# EAGLE design QTP-BITTREE PATCHBAY REV 2.1 (EAGLE 7.3.2)
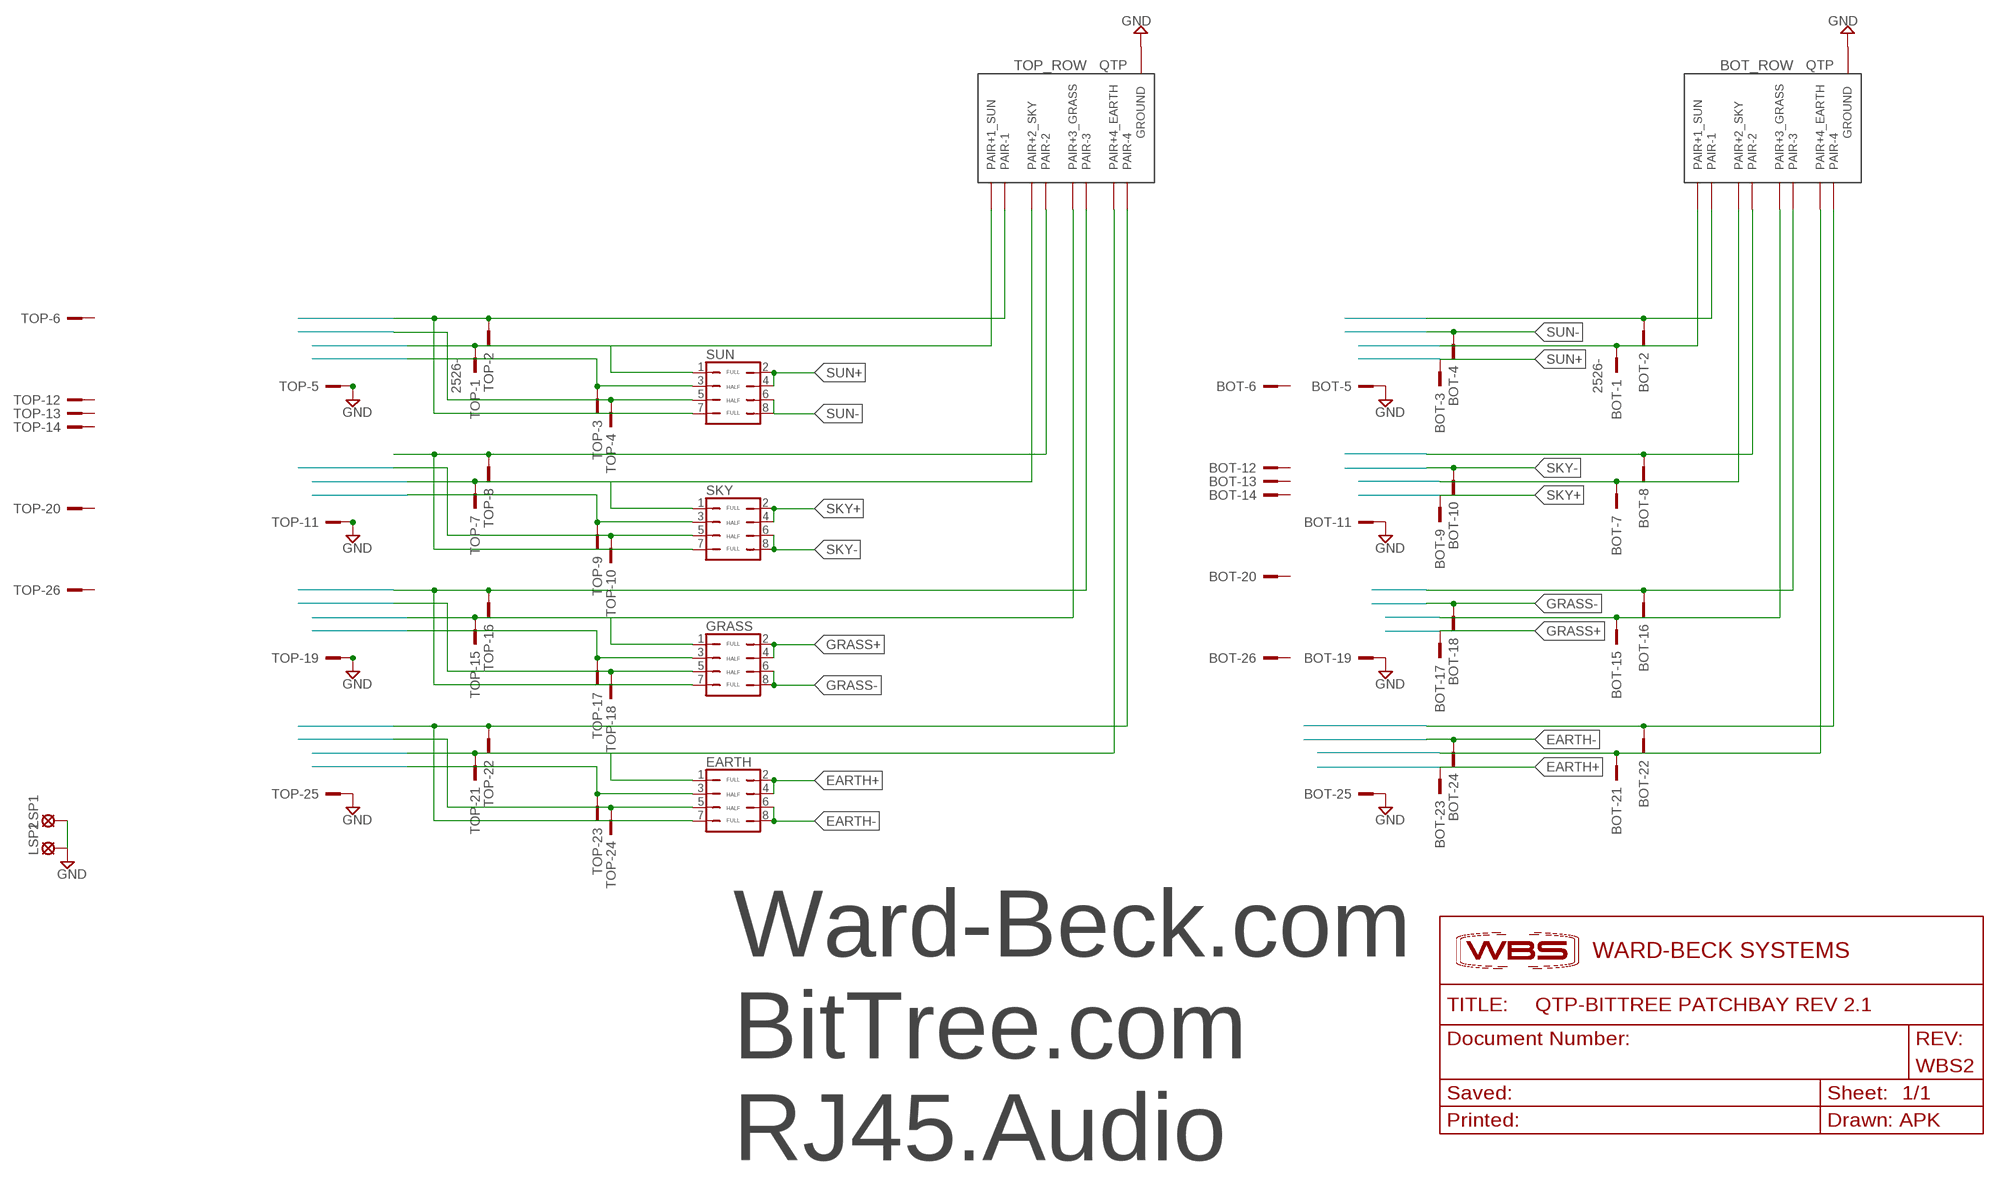
[diagram p0: schematic, sheet 1]

## Parts
BOT  2526-  [PAK100/2500-26]
BOT_ROW  CON-QTP_VERT  [ASSMAN-RJ45_VERT]
EARTH  JP4Q  [JP4Q]
GRASS  JP4Q  [JP4Q]
LSP1  LSP13  [LSP13]
LSP2  LSP13  [LSP13]
SKY  JP4Q  [JP4Q]
SUN  JP4Q  [JP4Q]
TOP  2526-  [PAK100/2500-26]
TOP_ROW  CON-QTP_VERT  [ASSMAN-RJ45_VERT]

## Nets
EARTH+: BOT.23 EARTH.2 EARTH.4
EARTH-: BOT.24 EARTH.6 EARTH.8
GND: BOT.5 BOT.11 BOT.19 BOT.25 BOT_ROW.P$9(GROUND) BOT_ROW.P$10(GROUND) BOT_ROW.P$11(GROUND) BOT_ROW.P$12(GROUND) LSP1.MP LSP2.MP TOP.5 TOP.11 TOP.19 TOP.25 TOP_ROW.P$9(GROUND) TOP_ROW.P$10(GROUND) TOP_ROW.P$11(GROUND) TOP_ROW.P$12(GROUND)
GRASS+: BOT.17 GRASS.2 GRASS.4
GRASS-: BOT.18 GRASS.6 GRASS.8
N$2: SUN.7 TOP.2 TOP_ROW.P$1(PAIR-1)
N$3: SKY.1 TOP.7 TOP_ROW.P$4(PAIR+2_SKY)
N$4: BOT.1 BOT_ROW.P$2(PAIR+1_SUN)
N$5: GRASS.1 TOP.15 TOP_ROW.P$6(PAIR+3_GRASS)
N$6: BOT.2 BOT_ROW.P$1(PAIR-1)
N$8: EARTH.1 TOP.21 TOP_ROW.P$8(PAIR+4_EARTH)
N$9: SUN.3 TOP.3
N$10: SUN.5 TOP.4
N$11: BOT.7 BOT_ROW.P$4(PAIR+2_SKY)
N$12: SKY.7 TOP.8 TOP_ROW.P$5(PAIR-2)
N$13: SKY.3 TOP.9
N$14: SKY.5 TOP.10
N$15: BOT.15 BOT_ROW.P$6(PAIR+3_GRASS)
N$16: GRASS.7 TOP.16 TOP_ROW.P$3(PAIR-3)
N$17: GRASS.3 TOP.17
N$18: GRASS.5 TOP.18
N$19: BOT.21 BOT_ROW.P$8(PAIR+4_EARTH)
N$20: EARTH.7 TOP.22 TOP_ROW.P$7(PAIR-4)
N$21: EARTH.3 TOP.23
N$22: EARTH.5 TOP.24
N$26: BOT.8 BOT_ROW.P$5(PAIR-2)
N$29: BOT.16 BOT_ROW.P$3(PAIR-3)
N$32: BOT.22 BOT_ROW.P$7(PAIR-4)
SKY+: BOT.9 SKY.2 SKY.4
SKY-: BOT.10 SKY.6 SKY.8
SUN+: BOT.3 SUN.2 SUN.4
SUN-: BOT.4 SUN.6 SUN.8
TOP-P1: SUN.1 TOP.1 TOP_ROW.P$2(PAIR+1_SUN)
Unconnected: BOT.6 BOT.12 BOT.13 BOT.14 BOT.20 BOT.26 TOP.6 TOP.12 TOP.13 TOP.14 TOP.20 TOP.26

## Notes on the sheet
- FULL
- HALF
- HALF
- FULL
- FULL
- HALF
- HALF
- FULL
- FULL
- HALF
- HALF
- FULL
- FULL
- HALF
- HALF
- FULL
- Ward-Beck.com
- BitTree.com
  RJ45.Audio

## Library data of the parts
BOT TOP = con-3m:2526-: 3M (TM) Pak 100 4-Wall Header Source: 3M; OC_FARNELL: unknown; OC_NEWARK: unknown
BOT_ROW TOP_ROW = APK - PARTS:CON-QTP_VERT
EARTH GRASS SKY SUN = jumper:JP4Q: JUMPER
LSP1 LSP2 = solpad:LSP13: SOLDER PAD drill 1.3 mm, distributor Buerklin, 12H562

## Board
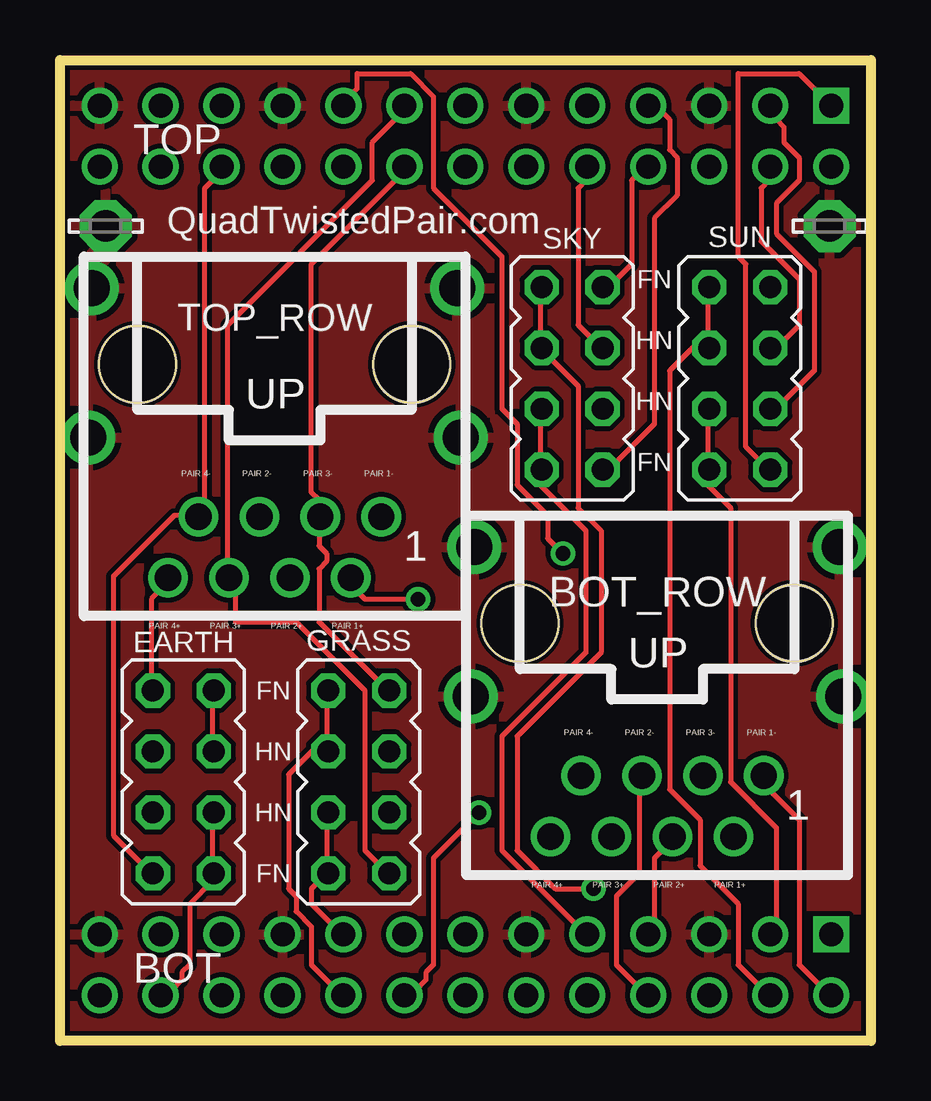
[diagram p1: board, top side]
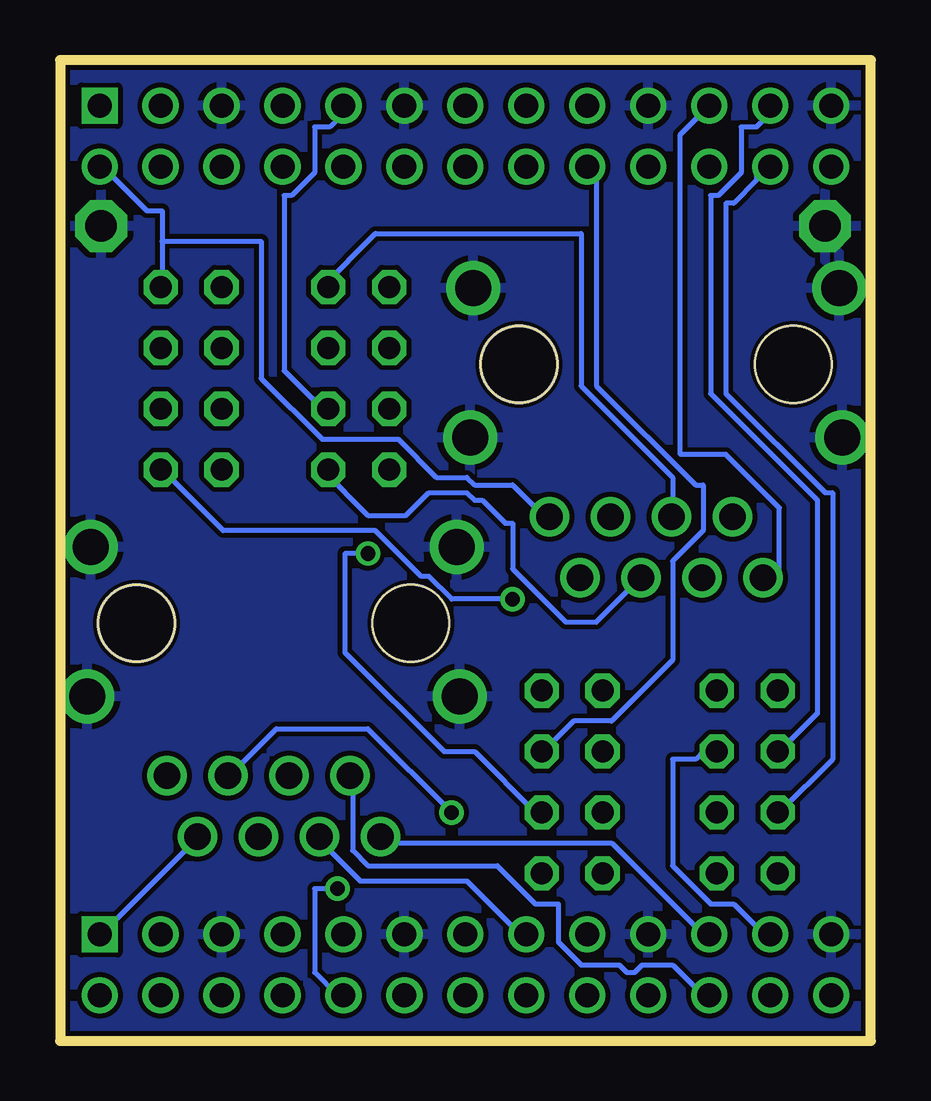
[diagram p2: board, bottom side, seen from below]

Size 33.78 x 40.89 mm. Coordinates in mm from the lower left corner, seen from the top.
Outline: 0,40.89 33.78,40.89 33.78,0 0,0 0,40.89
Copper layers (1*16): Top 0.035mm / dielectric 1.5mm / Bottom 0.035mm
Design rules "default *": minimum track width 8mil, minimum drill 24mil, track to track 8mil, track to pad 8mil, pad to pad 8mil, via to via 8mil, smd to smd 8mil, copper to edge 8mil, drill to drill 8mil, minimum pad ring 10mil, minimum via ring 8mil, stop-mask expansion 4mil, vias tented up to drill 0mil, thermal gap 10mil
vRestrict: area 2.5,15.9 to 15.9,17.8; area 7.6,6.4 to 10.2,15.9; area 4.4,32.4 to 31.1,34.9; area 23.5,23.5 to 26,33.7; area 30.5,24.1 to 33.7,31.1; area 0,7 to 2.5,15.2

### Footprints (pad centres in the part's own frame; a part is rotated, then mirrored left to right if it is on the bottom)
PAK100/2500-26 = drill 1 pad 1.422 square: 1 -15.24,-1.27 | drill 1 pad 1.422: 2 -15.24,1.27; 3 -12.7,-1.27; 4 -12.7,1.27; 5 -10.16,-1.27; 6 -10.16,1.27; 7 -7.62,-1.27; 8 -7.62,1.27; 9 -5.08,-1.27; 10 -5.08,1.27; 11 -2.54,-1.27; 12 -2.54,1.27; 13 0,-1.27; 14 0,1.27; 15 2.54,-1.27; 16 2.54,1.27; 17 5.08,-1.27; 18 5.08,1.27; 19 7.62,-1.27; 20 7.62,1.27; 21 10.16,-1.27; 22 10.16,1.27; 23 12.7,-1.27; 24 12.7,1.27; 25 15.24,-1.27; 26 15.24,1.27
ASSMAN-RJ45_VERT = drill 1.1: P$1 -4.432,10.846; P$2 -3.162,13.386; P$3 -1.892,10.846; P$4 -0.622,13.386; P$5 0.648,10.846; P$6 1.918,13.386; P$7 3.188,10.846; P$8 4.458,13.386 | drill 1.5: P$9 -7.607,1.321; P$10 7.633,1.321; P$11 -7.744,7.539; P$12 7.767,7.539 | hole 3.2: -5.702,4.496; 5.728,4.496 | hole 3.175: -5.702,4.496
JP4Q = drill 0.914 octagon: 1 -3.81,-1.27; 2 -3.81,1.27; 3 -1.27,-1.27; 4 -1.27,1.27; 5 1.27,-1.27; 6 1.27,1.27; 7 3.81,-1.27; 8 3.81,1.27
LSP13 = drill 1.321 pad 2.159 octagon: MP 0,0

### Placement (x,y rotation side)
BOT  16.89,3.17 180 top
BOT_ROW  24.89,21.91 180 top
EARTH  5.14,10.79 270 top
GRASS  12.45,10.79 90 top
LSP1  1.91,33.97 0 top
LSP2  32.07,33.97 180 top
SKY  21.34,27.62 90 top
SUN  28.32,27.62 90 top
TOP  16.89,37.72 180 top
TOP_ROW  8.95,32.7 180 top

### Tracks (layer width: path | path; a pad name or v marks a point on that pad's centre or on a via)
EARTH+
  Top 0.203: EARTH.4 6.35,12.06 6.35,14.61 EARTH.2
  Bottom 0.203: EARTH.4 6.99,12.06 7.3,11.75 8.26,11.75 8.26,7.3 6.67,5.71 5.71,5.71 4.45,4.45 BOT.23
EARTH-
  Top 0.203: 6.35,6.99 6.35,9.53 EARTH.6 | 6.35,6.99 6.35,6.67 5.4,5.71 5.4,3.17 5.08,2.86 5.08,2.54 4.45,1.91 BOT.24 | 6.35,6.99 EARTH.8
GND
  pour Bottom: 0,40.89 33.78,40.89 33.78,0 0,0
  pour Top: 0,40.89 33.78,40.89 33.78,0 0,0
GRASS+
  Top 0.203: 11.11,6.99 11.11,9.53 GRASS.4 | 11.11,6.99 10.48,6.35 10.48,5.71 11.75,4.45 BOT.17 | 11.11,6.99 GRASS.2
GRASS-
  Top 0.203: 11.11,12.7 11.11,14.61 GRASS.8 | 11.11,12.7 11.11,12.06 GRASS.6 11.11,12.7 | 11.11,12.7 9.53,11.11 9.53,6.35 9.84,6.03 9.84,5.4 10.48,4.76 10.48,3.17 11.75,1.91 BOT.18
N$2
  Bottom 0.203: 29.53,33.34 29.53,34.61 30.16,34.61 31.75,36.2 32.07,36.2 TOP.2 | 29.53,33.34 29.53,31.43 SUN.7 | 29.53,33.34 25.4,33.34 25.4,27.62 22.86,25.08 19.68,25.08 18.1,23.5 16.83,23.5 16.51,23.18 14.92,23.18 13.65,21.91 TOP_ROW.P$1
N$3
  Top 0.203: SKY.1 22.86,23.81 24.77,25.72 24.77,34.29 25.72,35.24 25.72,36.83 25.4,37.15 25.4,38.42 24.77,39.05 TOP.7
  Bottom 0.203: TOP_ROW.P$4 11.43,17.46 12.7,17.46 14.92,19.68 14.92,21.59 15.24,21.59 16.19,22.54 16.51,22.54 16.83,22.86 18.41,22.86 19.37,21.91 20.95,21.91 22.86,23.81 SKY.1
N$4
  Bottom 0.203: BOT.1 32.07,4.45 28.26,8.26 BOT_ROW.P$2
N$5
  Top 0.203: GRASS.1 13.65,6.99 12.7,7.94 12.7,14.61 9.84,17.46 7.3,17.46 7.3,19.05 TOP_ROW.P$6 6.99,19.37 6.99,29.84 13.02,35.88 13.02,37.47 14.29,38.73 TOP.15
N$6
  Top 0.203: BOT.2 32.07,1.91 30.8,3.17 30.8,9.21 29.53,10.48 29.53,10.79 BOT_ROW.P$1
N$8
  Top 0.203: EARTH.1 3.81,14.61 3.81,18.41 4.45,19.05 TOP_ROW.P$8
  Bottom 0.203: TOP.21 7.94,37.78 7.94,24.45 6.03,24.45 3.81,22.23 3.81,19.37 4.45,19.37 TOP_ROW.P$8
N$9
  Top 0.203: SUN.3 29.84,26.35 31.43,27.94 31.43,32.07 29.84,33.66 29.84,34.92 30.8,35.88 30.8,36.83 30.16,37.47 30.16,38.1 29.84,38.42 29.84,38.73 TOP.3
N$10
  Top 0.203: SUN.5 29.84,28.89 30.8,29.84 30.8,31.75 29.21,33.34 29.21,35.56 29.53,35.88 29.53,36.2 TOP.4
N$11
  Top 0.203: BOT.7 24.77,4.45 24.77,7.62 25.4,8.26 BOT_ROW.P$4
N$12
  Top 0.203: SKY.7 22.86,31.43 23.81,32.38 23.81,35.88 24.45,36.51 TOP.8
  Bottom 0.203: TOP_ROW.P$5 8.26,21.91 8.26,23.5 12.06,27.3 12.06,33.66 20.64,33.66 22.86,31.43 SKY.7
N$13
  Bottom 0.203: SKY.3 22.86,26.35 24.45,27.94 24.45,35.24 24.13,35.24 23.18,36.2 23.18,38.1 22.54,38.1 21.91,38.73 TOP.9
N$14
  Top 0.203: SKY.5 22.54,28.89 21.59,29.84 21.59,35.56 21.91,35.88 21.91,36.2 TOP.10
N$15
  Bottom 0.203: BOT.15 14.61,4.45 16.83,6.67 21.27,6.67 22.86,8.26 BOT_ROW.P$6
N$16
  Top 0.203: GRASS.7 13.65,14.61 10.79,17.46 10.79,19.68 11.11,20 11.11,20.32 10.79,20.64 10.79,21.59 TOP_ROW.P$3 10.79,21.91 10.79,22.54 10.48,22.86 10.48,32.38 14.29,36.2 TOP.16
N$17  (via drill 0.61)
  Top 0.203: v20.95,20.32 20.32,20.95 20.32,21.91 19.05,23.18 19.05,25.72 18.41,26.35 18.41,32.7 15.56,35.56 15.56,39.37 14.61,40.32 12.38,40.32 12.38,39.69 12.06,39.37 12.06,39.05 TOP.17
  Bottom 0.203: v20.95,20.32 21.91,20.32 21.91,16.19 17.78,12.06 16.51,12.06 13.97,9.53 GRASS.3
N$18
  Bottom 0.203: GRASS.5 13.65,12.06 12.38,13.34 10.79,13.34 8.26,15.88 8.26,20 6.99,21.27 6.99,23.18 7.3,23.18 11.43,27.3 11.43,36.2 11.75,36.2 TOP.18
N$19
  Bottom 0.203: BOT.21 6.99,4.45 10.79,8.26 20.32,8.26 BOT_ROW.P$8
N$20
  Top 0.203: EARTH.7 3.81,6.99 2.22,8.57 2.22,19.37 4.76,21.91 5.71,21.91 TOP_ROW.P$7 6.03,21.91 6.03,35.56 6.67,36.2 TOP.22
N$21
  Bottom 0.203: EARTH.3 3.81,12.06 2.22,13.65 2.22,22.54 6.67,26.99 6.67,35.24 6.35,35.24 5.4,36.2 5.4,38.1 4.76,38.1 4.13,38.73 TOP.23
N$22
  Bottom 0.203: EARTH.5 3.81,9.53 1.59,11.75 1.59,22.86 1.91,22.86 6.03,26.99 6.03,34.92 5.71,34.92 4.76,35.88 4.76,36.2 4.45,36.2 TOP.24
N$26
  Top 0.203: BOT.8 24.45,1.91 23.18,3.17 23.18,6.03 24.13,6.99 24.13,10.79 BOT_ROW.P$5
N$29  (via drill 0.61)
  Top 0.203: v17.46,9.53 15.56,7.62 15.56,3.17 15.24,2.86 15.24,2.54 14.61,1.91 BOT.16
  Bottom 0.203: v17.46,9.53 20.95,13.02 24.77,13.02 26.67,11.11 BOT_ROW.P$3
N$32
  Bottom 0.203: BOT.22 6.99,1.91 8.26,3.17 9.53,3.17 9.84,2.86 10.16,2.86 10.48,3.17 12.06,3.17 13.02,4.13 13.02,5.71 13.97,5.71 15.56,7.3 20.95,7.3 21.59,7.94 21.59,10.79 BOT_ROW.P$7
SKY+
  Top 0.203: 20,23.81 20,26.35 SKY.4 | 20,23.81 20,23.18 21.91,21.27 21.91,16.19 18.41,12.7 18.41,7.94 21.91,4.45 BOT.9 | 20,23.81 SKY.2
SKY-  (via drill 0.61)
  Top 0.203: SKY.8 20,31.43 20,28.89 SKY.6 20.32,28.89 20.32,28.57 21.59,27.3 21.59,22.23 22.54,21.27 22.54,16.19 19.05,12.7 19.05,7.94 20.64,6.35 v22.23,6.35
  Bottom 0.203: v22.23,6.35 23.18,6.35 23.18,2.86 22.23,1.91 BOT.10
SUN+
  Top 0.203: 26.99,23.81 26.99,26.35 SUN.4 | 26.99,23.81 26.99,23.18 27.94,22.23 27.94,10.79 29.84,8.89 29.84,4.45 BOT.3 | 26.99,23.81 SUN.2
SUN-
  Top 0.203: 26.99,29.53 26.99,31.43 SUN.8 | 26.99,29.53 26.99,28.89 SUN.6 26.99,29.53 | 26.99,29.53 25.4,27.94 25.4,10.48 26.67,9.21 26.67,7.3 28.26,5.71 28.26,3.17 29.53,1.91 BOT.4
TOP-P1  (via drill 0.61)
  Top 0.203: v14.92,18.41 12.7,18.41 12.38,18.73 12.38,19.05 TOP_ROW.P$2 | TOP.1 30.8,40.32 28.26,40.32 28.26,32.7 28.57,32.38 28.57,24.77 29.53,23.81 SUN.1
  Bottom 0.203: v14.92,18.41 17.46,18.41 18.41,19.37 18.73,19.37 20.64,21.27 26.99,21.27 29.53,23.81 SUN.1

### Text on the board
tPlace: QuadTwistedPair.com | FN | HN | HN | FN | FN | HN | HN | FN
Document: QuadTwistedPair.audio | RJ45.audio | Ward-Beck.com | BitTree.com